# Altium schematic sheet 20_Sensores.SchDoc
size A4; SheetNumber: 3; SheetTotal: 6
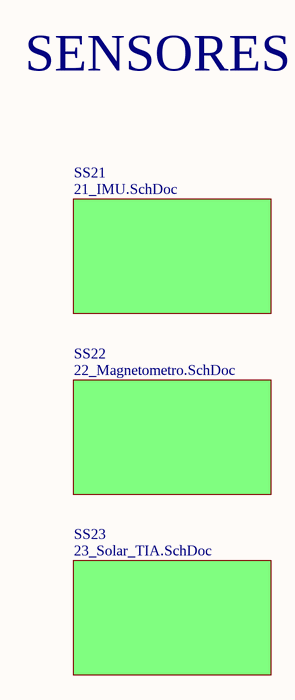
[diagram p0: 20_Sensores.SchDoc]

## Sub-sheets
SS21 = 21_IMU.SchDoc: no entries
SS22 = 22_Magnetometro.SchDoc: no entries
SS23 = 23_Solar_TIA.SchDoc: no entries

## Notes on the sheet
- SENSORES